# Altium schematic sheet Lamps_board.SchDoc
size A4
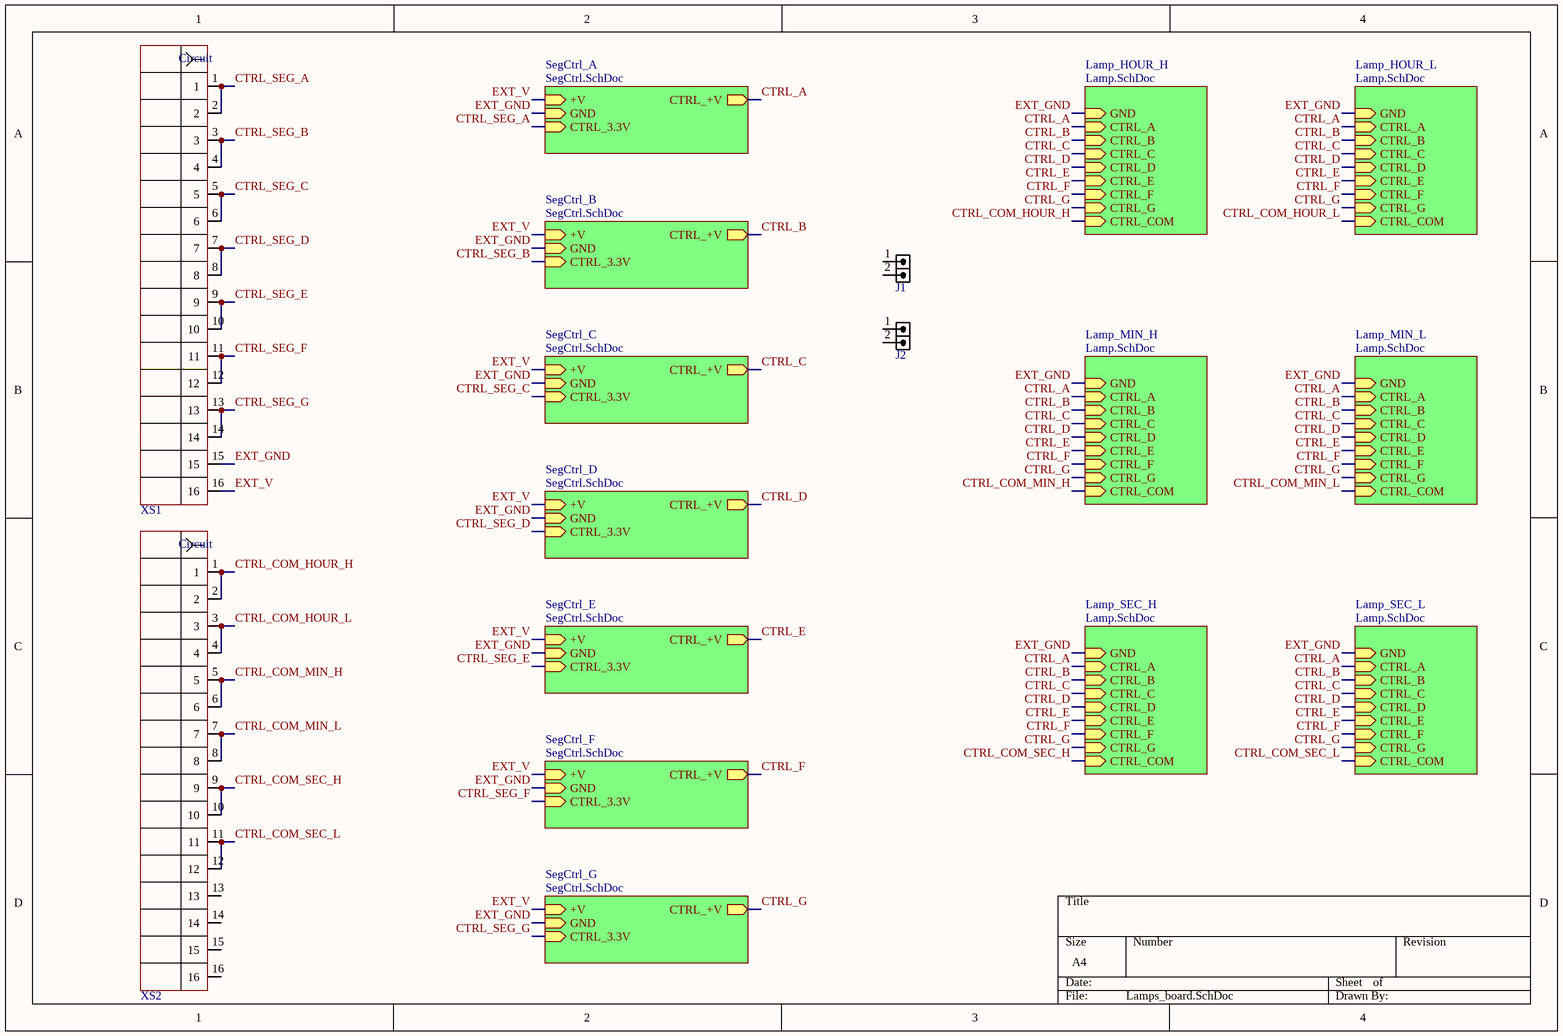
[diagram p0: Lamps_board.SchDoc]

## Parts
J1  HDRM2  [HDR_M_1X2]  (value not drawn)
J2  HDRM2  [HDR_M_1X2]  (value not drawn)
XS1  PBD-16  [PBD-16-3D]  (value not drawn)
XS2  PBD-16  [PBD-16-3D]  (value not drawn)

## Sub-sheets
Lamp_HOUR_H = Lamp.SchDoc: GND (in), CTRL_A (in), CTRL_B (in), CTRL_C (in), CTRL_D (in), CTRL_E (in), CTRL_F (in), CTRL_G (in), CTRL_COM (in)
Lamp_HOUR_L = Lamp.SchDoc: GND (in), CTRL_A (in), CTRL_B (in), CTRL_C (in), CTRL_D (in), CTRL_E (in), CTRL_F (in), CTRL_G (in), CTRL_COM (in)
Lamp_MIN_H = Lamp.SchDoc: GND (in), CTRL_A (in), CTRL_B (in), CTRL_C (in), CTRL_D (in), CTRL_E (in), CTRL_F (in), CTRL_G (in), CTRL_COM (in)
Lamp_MIN_L = Lamp.SchDoc: GND (in), CTRL_A (in), CTRL_B (in), CTRL_C (in), CTRL_D (in), CTRL_E (in), CTRL_F (in), CTRL_G (in), CTRL_COM (in)
Lamp_SEC_H = Lamp.SchDoc: GND (in), CTRL_A (in), CTRL_B (in), CTRL_C (in), CTRL_D (in), CTRL_E (in), CTRL_F (in), CTRL_G (in), CTRL_COM (in)
Lamp_SEC_L = Lamp.SchDoc: GND (in), CTRL_A (in), CTRL_B (in), CTRL_C (in), CTRL_D (in), CTRL_E (in), CTRL_F (in), CTRL_G (in), CTRL_COM (in)
SegCtrl_A = SegCtrl.SchDoc: +V (in), GND (in), CTRL_3.3V (in), CTRL_+V (out)
SegCtrl_B = SegCtrl.SchDoc: +V (in), GND (in), CTRL_3.3V (in), CTRL_+V (out)
SegCtrl_C = SegCtrl.SchDoc: +V (in), GND (in), CTRL_3.3V (in), CTRL_+V (out)
SegCtrl_D = SegCtrl.SchDoc: +V (in), GND (in), CTRL_3.3V (in), CTRL_+V (out)
SegCtrl_E = SegCtrl.SchDoc: +V (in), GND (in), CTRL_3.3V (in), CTRL_+V (out)
SegCtrl_F = SegCtrl.SchDoc: +V (in), GND (in), CTRL_3.3V (in), CTRL_+V (out)
SegCtrl_G = SegCtrl.SchDoc: +V (in), GND (in), CTRL_3.3V (in), CTRL_+V (out)

## Nets
CTRL_A: sheet Lamp_HOUR_H/CTRL_A, sheet Lamp_HOUR_L/CTRL_A, sheet Lamp_MIN_H/CTRL_A, sheet Lamp_SEC_L/CTRL_A, sheet Lamp_MIN_L/CTRL_A, sheet Lamp_SEC_H/CTRL_A, sheet SegCtrl_A/CTRL_+V
CTRL_B: sheet Lamp_HOUR_H/CTRL_B, sheet Lamp_HOUR_L/CTRL_B, sheet Lamp_MIN_H/CTRL_B, sheet Lamp_SEC_L/CTRL_B, sheet Lamp_MIN_L/CTRL_B, sheet Lamp_SEC_H/CTRL_B, sheet SegCtrl_B/CTRL_+V
CTRL_C: sheet Lamp_HOUR_H/CTRL_C, sheet Lamp_HOUR_L/CTRL_C, sheet Lamp_MIN_H/CTRL_C, sheet Lamp_SEC_L/CTRL_C, sheet Lamp_MIN_L/CTRL_C, sheet Lamp_SEC_H/CTRL_C, sheet SegCtrl_C/CTRL_+V
CTRL_COM_HOUR_H: XS2.1 XS2.2 ; sheet Lamp_HOUR_H/CTRL_COM
CTRL_COM_HOUR_L: XS2.3 XS2.4 ; sheet Lamp_HOUR_L/CTRL_COM
CTRL_COM_MIN_H: XS2.5 XS2.6 ; sheet Lamp_MIN_H/CTRL_COM
CTRL_COM_MIN_L: XS2.7 XS2.8 ; sheet Lamp_MIN_L/CTRL_COM
CTRL_COM_SEC_H: XS2.9 XS2.10 ; sheet Lamp_SEC_H/CTRL_COM
CTRL_COM_SEC_L: XS2.11 XS2.12 ; sheet Lamp_SEC_L/CTRL_COM
CTRL_D: sheet Lamp_HOUR_H/CTRL_D, sheet Lamp_HOUR_L/CTRL_D, sheet Lamp_MIN_H/CTRL_D, sheet Lamp_SEC_L/CTRL_D, sheet Lamp_MIN_L/CTRL_D, sheet Lamp_SEC_H/CTRL_D, sheet SegCtrl_D/CTRL_+V
CTRL_E: sheet Lamp_HOUR_H/CTRL_E, sheet Lamp_HOUR_L/CTRL_E, sheet Lamp_MIN_H/CTRL_E, sheet Lamp_SEC_L/CTRL_E, sheet Lamp_MIN_L/CTRL_E, sheet Lamp_SEC_H/CTRL_E, sheet SegCtrl_E/CTRL_+V
CTRL_F: sheet Lamp_HOUR_H/CTRL_F, sheet Lamp_HOUR_L/CTRL_F, sheet Lamp_MIN_H/CTRL_F, sheet Lamp_SEC_L/CTRL_F, sheet Lamp_MIN_L/CTRL_F, sheet Lamp_SEC_H/CTRL_F, sheet SegCtrl_F/CTRL_+V
CTRL_G: sheet Lamp_HOUR_H/CTRL_G, sheet Lamp_HOUR_L/CTRL_G, sheet Lamp_MIN_H/CTRL_G, sheet Lamp_SEC_L/CTRL_G, sheet Lamp_MIN_L/CTRL_G, sheet Lamp_SEC_H/CTRL_G, sheet SegCtrl_G/CTRL_+V
CTRL_SEG_A: XS1.1 XS1.2 ; sheet SegCtrl_A/CTRL_3.3V
CTRL_SEG_B: XS1.3 XS1.4 ; sheet SegCtrl_B/CTRL_3.3V
CTRL_SEG_C: XS1.5 XS1.6 ; sheet SegCtrl_C/CTRL_3.3V
CTRL_SEG_D: XS1.7 XS1.8 ; sheet SegCtrl_D/CTRL_3.3V
CTRL_SEG_E: XS1.9 XS1.10 ; sheet SegCtrl_E/CTRL_3.3V
CTRL_SEG_F: XS1.11 XS1.12 ; sheet SegCtrl_F/CTRL_3.3V
CTRL_SEG_G: XS1.13 XS1.14 ; sheet SegCtrl_G/CTRL_3.3V
EXT_GND: XS1.15 ; sheet Lamp_HOUR_H/GND, sheet Lamp_HOUR_L/GND, sheet Lamp_MIN_H/GND, sheet Lamp_SEC_L/GND, sheet Lamp_MIN_L/GND, sheet Lamp_SEC_H/GND, sheet SegCtrl_A/GND, sheet SegCtrl_B/GND, sheet SegCtrl_C/GND, sheet SegCtrl_D/GND, sheet SegCtrl_E/GND, sheet SegCtrl_F/GND, sheet SegCtrl_G/GND
EXT_V: XS1.16 ; sheet SegCtrl_A/+V, sheet SegCtrl_B/+V, sheet SegCtrl_C/+V, sheet SegCtrl_D/+V, sheet SegCtrl_E/+V, sheet SegCtrl_F/+V, sheet SegCtrl_G/+V

Not connected (* = marked no-connect by the designer): J1 1 2; J2 1 2; XS2 13 14 15 16

## Notes on the sheet
- (in symbol SH2-16G) Circuit

## Library data of the parts
J1 J2 = HDR_M_1X2: CONN, HEADER, Male, pitch: 2.54mm, 2POS; VALUE: HDRM2
XS1 XS2 = SH2-16G: CONN RCPT 16POS 0.1 GOLD PCB; System: Connector; Part Number: SH2-16G; Manufacturer Part Number: SH2-16G; Digi-Key Part Number: ED3071-ND; Price$: 0.20250; Package: Socket 16POS 2.54mm; HelpURL: https://www.digikey.com/en/products/detail/on-shore-technology-inc/SH2-16G/2721215